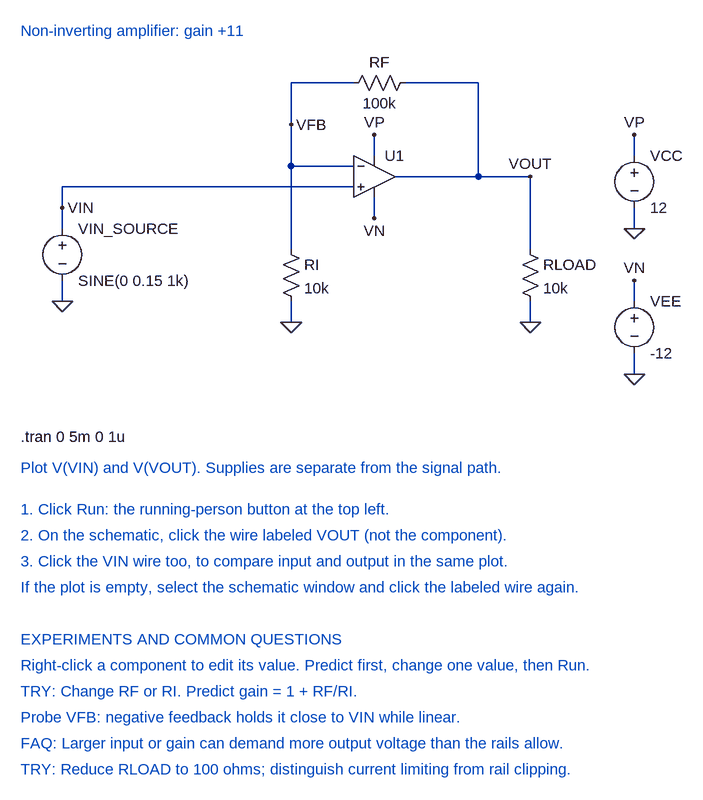
[diagram p0: schematic 05-non-inverting-amplifier.asc]
05-non-inverting-amplifier.asc, the LTspice schematic file:
Version 4
SHEET 1 1200 1400
WIRE 608 224 608 192
WIRE 608 288 608 320
WIRE 128 304 128 336
WIRE 128 416 128 448
WIRE 128 304 128 272
WIRE 128 272 576 272
WIRE 640 256 848 256
WIRE 848 256 848 368
WIRE 848 448 848 480
WIRE 480 240 480 112
WIRE 480 112 576 112
WIRE 656 112 768 112
WIRE 768 112 768 256
WIRE 480 240 576 240
WIRE 480 240 480 368
WIRE 480 448 480 480
WIRE 1008 192 1008 224
WIRE 1008 304 1008 336
WIRE 1008 416 1008 448
WIRE 1008 528 1008 560
FLAG 608 192 VP
FLAG 608 320 VN
FLAG 128 304 VIN
FLAG 128 448 0
FLAG 848 256 VOUT
FLAG 848 480 0
FLAG 480 176 VFB
FLAG 480 480 0
FLAG 1008 192 VP
FLAG 1008 336 0
FLAG 1008 416 VN
FLAG 1008 560 0
SYMBOL Opamps\UniversalOpamp2 608 256 R0
SYMATTR InstName U1
SYMBOL voltage 128 320 R0
SYMATTR InstName VIN_SOURCE
SYMATTR Value SINE(0 0.15 1k)
SYMBOL res 832 352 R0
SYMATTR InstName RLOAD
SYMATTR Value 10k
SYMBOL res 672 96 R90
WINDOW 0 0 56 VBottom 2
WINDOW 3 32 56 VTop 2
SYMATTR InstName RF
SYMATTR Value 100k
SYMBOL res 464 352 R0
SYMATTR InstName RI
SYMATTR Value 10k
SYMBOL voltage 1008 208 R0
SYMATTR InstName VCC
SYMATTR Value 12
SYMBOL voltage 1008 432 R0
SYMATTR InstName VEE
SYMATTR Value -12
TEXT 64 32 Left 2 ;Non-inverting amplifier: gain +11
TEXT 64 656 Left 2 !.tran 0 5m 0 1u
TEXT 64 704 Left 2 ;Plot V(VIN) and V(VOUT). Supplies are separate from the signal path.
TEXT 64 768 Left 2 ;1. Click Run: the running-person button at the top left.
TEXT 64 808 Left 2 ;2. On the schematic, click the wire labeled VOUT (not the component).
TEXT 64 848 Left 2 ;3. Click the VIN wire too, to compare input and output in the same plot.
TEXT 64 888 Left 2 ;If the plot is empty, select the schematic window and click the labeled wire again.
TEXT 64 968 Left 2 ;EXPERIMENTS AND COMMON QUESTIONS
TEXT 64 1008 Left 2 ;Right-click a component to edit its value. Predict first, change one value, then Run.
TEXT 64 1048 Left 2 ;TRY: Change RF or RI. Predict gain = 1 + RF/RI.
TEXT 64 1088 Left 2 ;Probe VFB: negative feedback holds it close to VIN while linear.
TEXT 64 1128 Left 2 ;FAQ: Larger input or gain can demand more output voltage than the rails allow.
TEXT 64 1168 Left 2 ;TRY: Reduce RLOAD to 100 ohms; distinguish current limiting from rail clipping.

The netlist it stands for:
* 05-non-inverting-amplifier.asc
XU1 VIN VFB VP VN VOUT level.2 Avol=1Meg GBW=10Meg Slew=10Meg ilimit=25m rail=0 Vos=0 phimargin=45 en=0 enk=0 in=0 ink=0 Rin=500Meg  ; pins IN+ IN- V+ V- OUT
VIN_SOURCE VIN 0 SINE(0 0.15 1k)
RLOAD VOUT 0 10k
RF VOUT VFB 100k
RI VFB 0 10k
VCC VP 0 12
VEE VN 0 -12
* Non-inverting amplifier: gain +11
.tran 0 5m 0 1u
* Plot V(VIN) and V(VOUT). Supplies are separate from the signal path.
* 1. Click Run: the running-person button at the top left.
* 2. On the schematic, click the wire labeled VOUT (not the component).
* 3. Click the VIN wire too, to compare input and output in the same plot.
* If the plot is empty, select the schematic window and click the labeled wire again.
* EXPERIMENTS AND COMMON QUESTIONS
* Right-click a component to edit its value. Predict first, change one value, then Run.
* TRY: Change RF or RI. Predict gain = 1 + RF/RI.
* Probe VFB: negative feedback holds it close to VIN while linear.
* FAQ: Larger input or gain can demand more output voltage than the rails allow.
* TRY: Reduce RLOAD to 100 ohms; distinguish current limiting from rail clipping.
.lib UniversalOpamps2.sub
.backanno
.end